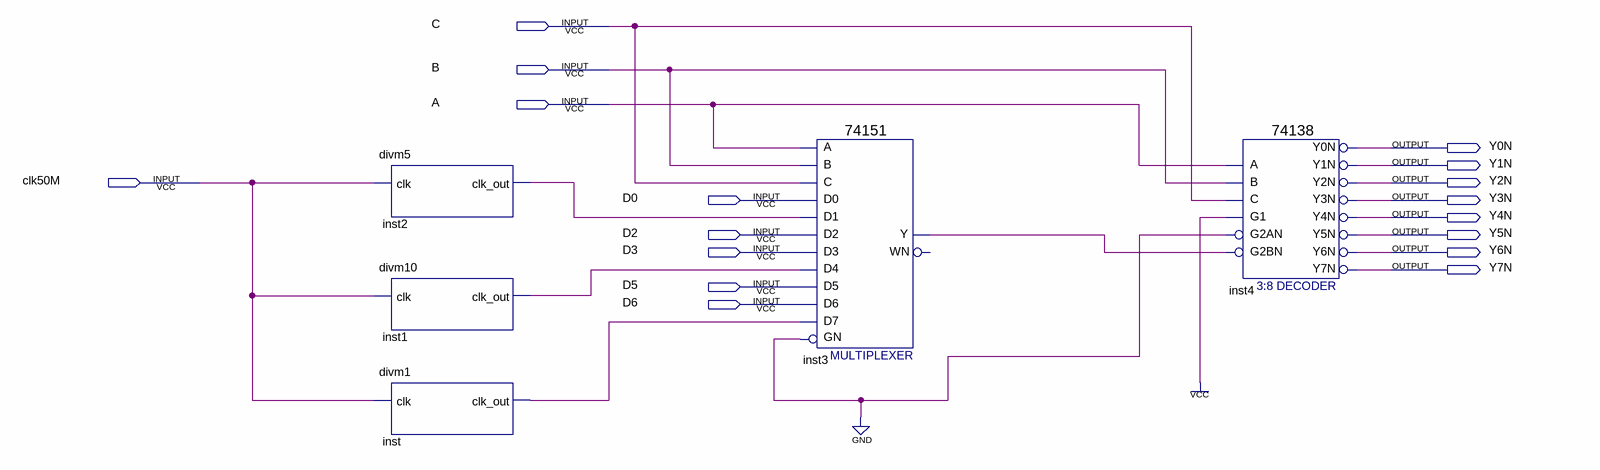
[diagram p0: schematic sheet]
// Quartus schematic frequency.bdf as structural Verilog: 5 symbols, 17 pins
module frequency (
  input  C,
  input  B,
  input  A,
  input  clk50M,
  input  D0,
  input  D2,
  input  D3,
  input  D5,
  input  D6,
  output Y0N,
  output Y1N,
  output Y2N,
  output Y3N,
  output Y4N,
  output Y5N,
  output Y6N,
  output Y7N
);

  wire inst1_clk_out, inst2_clk_out, inst3_y, inst_clk_out;

  divm5 inst2 (.clk(clk50M), .clk_out(inst2_clk_out));
  divm10 inst1 (.clk(clk50M), .clk_out(inst1_clk_out));
  divm1 inst (.clk(clk50M), .clk_out(inst_clk_out));
  \74151  inst3 (
    .GN(1'b0), .C(C), .B(B), .A(A), .D5(D5), .D0(D0), .D1(inst2_clk_out), .D4(inst1_clk_out), .D3(D3),
    .D2(D2), .D6(D6), .D7(inst_clk_out), .Y(inst3_y));  // open: WN
  \74138  inst4 (
    .A(A), .B(B), .G1(1'b1), .C(C), .G2AN(1'b0), .G2BN(inst3_y), .Y0N(Y0N), .Y1N(Y1N), .Y2N(Y2N), .Y3N(Y3N),
    .Y4N(Y4N), .Y5N(Y5N), .Y6N(Y6N), .Y7N(Y7N));
endmodule
